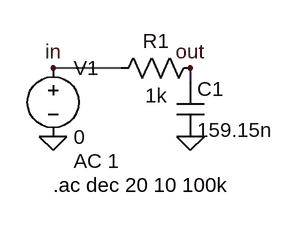
[diagram p0: schematic circuit.asc]
circuit.asc, the LTspice schematic file:
Version 4
SHEET 1 880 680
WIRE 0 16 80 16
WIRE 160 16 160 32
FLAG 0 96 0
FLAG 160 96 0
FLAG 0 16 in
FLAG 160 16 out
SYMBOL voltage 0 0 R0
WINDOW 123 24 124 Left 2
WINDOW 39 0 0 Left 0
SYMATTR Value2 AC 1
SYMATTR InstName V1
SYMATTR Value 0
SYMBOL res 64 32 R270
WINDOW 0 32 56 VTop 2
WINDOW 3 0 56 VBottom 2
SYMATTR InstName R1
SYMATTR Value 1k
SYMBOL cap 144 32 R0
SYMATTR InstName C1
SYMATTR Value 159.15n
TEXT 0 152 Left 2 !.ac dec 20 10 100k

The netlist it stands for:
* circuit.asc
V1 in 0 0 AC 1
R1 in out 1k
C1 out 0 159.15n
.ac dec 20 10 100k
.backanno
.end